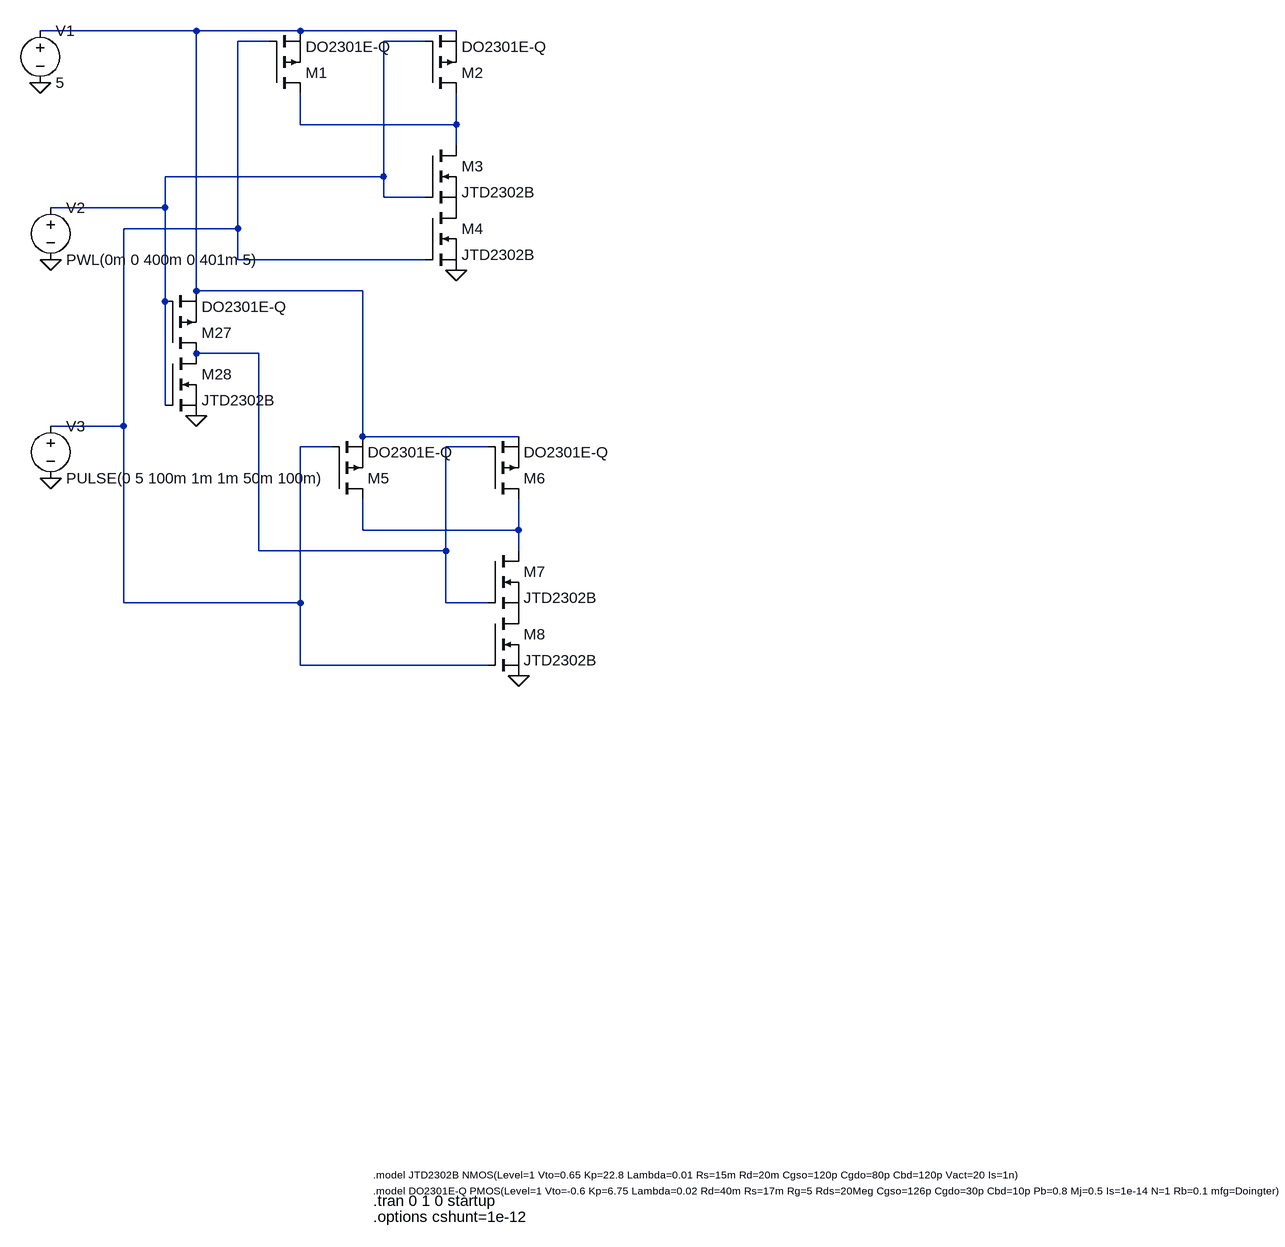
[diagram p0: schematic mainSimulation.asc]
mainSimulation.asc, the LTspice schematic file:
Version 4.1
SHEET 1 3032 680
WIRE -688 -1488 -928 -1488
WIRE -528 -1488 -688 -1488
WIRE -288 -1488 -528 -1488
WIRE -576 -1472 -624 -1472
WIRE -336 -1472 -400 -1472
WIRE -528 -1344 -528 -1392
WIRE -288 -1344 -288 -1392
WIRE -288 -1344 -528 -1344
WIRE -288 -1312 -288 -1344
WIRE -400 -1264 -400 -1472
WIRE -400 -1264 -736 -1264
WIRE -400 -1232 -400 -1264
WIRE -336 -1232 -400 -1232
WIRE -736 -1216 -736 -1264
WIRE -736 -1216 -912 -1216
WIRE -624 -1184 -624 -1472
WIRE -624 -1184 -800 -1184
WIRE -624 -1136 -624 -1184
WIRE -336 -1136 -624 -1136
WIRE -688 -1088 -688 -1488
WIRE -432 -1088 -688 -1088
WIRE -736 -1072 -736 -1216
WIRE -592 -992 -688 -992
WIRE -736 -912 -736 -1072
WIRE -800 -880 -800 -1184
WIRE -800 -880 -912 -880
WIRE -432 -864 -432 -1088
WIRE -192 -864 -432 -864
WIRE -480 -848 -528 -848
WIRE -240 -848 -304 -848
WIRE -432 -720 -432 -768
WIRE -192 -720 -192 -768
WIRE -192 -720 -432 -720
WIRE -592 -688 -592 -992
WIRE -304 -688 -304 -848
WIRE -304 -688 -592 -688
WIRE -192 -688 -192 -720
WIRE -800 -608 -800 -880
WIRE -528 -608 -528 -848
WIRE -528 -608 -800 -608
WIRE -304 -608 -304 -688
WIRE -240 -608 -304 -608
WIRE -528 -512 -528 -608
WIRE -240 -512 -528 -512
FLAG -688 -896 0
FLAG -288 -1120 0
FLAG -192 -496 0
FLAG -928 -1408 0
FLAG -912 -800 0
FLAG -912 -1136 0
SYMBOL pmos -736 -992 M180
SYMATTR InstName M27
SYMATTR Value DO2301E-Q
SYMBOL nmos -736 -992 R0
SYMATTR InstName M28
SYMATTR Value JTD2302B
SYMBOL pmos -576 -1392 M180
SYMATTR InstName M1
SYMATTR Value DO2301E-Q
SYMBOL pmos -336 -1392 M180
SYMATTR InstName M2
SYMATTR Value DO2301E-Q
SYMBOL nmos -336 -1312 R0
SYMATTR InstName M3
SYMATTR Value JTD2302B
SYMBOL nmos -336 -1216 R0
SYMATTR InstName M4
SYMATTR Value JTD2302B
SYMBOL pmos -480 -768 M180
SYMATTR InstName M5
SYMATTR Value DO2301E-Q
SYMBOL pmos -240 -768 M180
SYMATTR InstName M6
SYMATTR Value DO2301E-Q
SYMBOL nmos -240 -688 R0
SYMATTR InstName M7
SYMATTR Value JTD2302B
SYMBOL nmos -240 -592 R0
SYMATTR InstName M8
SYMATTR Value JTD2302B
SYMBOL voltage -928 -1504 R0
WINDOW 123 0 0 Left 0
WINDOW 39 0 0 Left 0
SYMATTR InstName V1
SYMATTR Value 5
SYMBOL voltage -912 -1232 R0
WINDOW 123 0 0 Left 0
WINDOW 39 0 0 Left 0
SYMATTR InstName V2
SYMATTR Value PWL(0m 0 400m 0 401m 5)
SYMBOL voltage -912 -896 R0
WINDOW 123 0 0 Left 0
WINDOW 39 0 0 Left 0
SYMATTR InstName V3
SYMATTR Value PULSE(0 5 100m 1m 1m 50m 100m)
TEXT -416 272 Left 1 !.model JTD2302B NMOS(Level=1 Vto=0.65 Kp=22.8 Lambda=0.01 Rs=15m Rd=20m Cgso=120p Cgdo=80p Cbd=120p Vact=20 Is=1n)
TEXT -416 296 Left 1 !.model DO2301E-Q PMOS(Level=1 Vto=-0.6 Kp=6.75 Lambda=0.02 Rd=40m Rs=17m Rg=5 Rds=20Meg Cgso=126p Cgdo=30p Cbd=10p Pb=0.8 Mj=0.5 Is=1e-14 N=1 Rb=0.1 mfg=Doingter)
TEXT -416 312 Left 2 !.tran 0 1 0 startup
TEXT -416 336 Left 2 !.options cshunt=1e-12

The netlist it stands for:
* mainSimulation.asc
M27 N005 N003 N001 N001 DO2301E-Q
M28 N005 N003 0 0 JTD2302B
M1 N004 N002 N001 N001 DO2301E-Q
M2 N004 N003 N001 N001 DO2301E-Q
M3 N004 N003 P001 P001 JTD2302B
M4 P001 N002 0 0 JTD2302B
M5 N006 N002 N001 N001 DO2301E-Q
M6 N006 N005 N001 N001 DO2301E-Q
M7 N006 N005 P002 P002 JTD2302B
M8 P002 N002 0 0 JTD2302B
V1 N001 0 5
V2 N003 0 PWL(0m 0 400m 0 401m 5)
V3 N002 0 PULSE(0 5 100m 1m 1m 50m 100m)
.model NMOS NMOS
.model PMOS PMOS
.lib standard.mos
.model JTD2302B NMOS(Level=1 Vto=0.65 Kp=22.8 Lambda=0.01 Rs=15m Rd=20m Cgso=120p Cgdo=80p Cbd=120p Vact=20 Is=1n)
.model DO2301E-Q PMOS(Level=1 Vto=-0.6 Kp=6.75 Lambda=0.02 Rd=40m Rs=17m Rg=5 Rds=20Meg Cgso=126p Cgdo=30p Cbd=10p Pb=0.8 Mj=0.5 Is=1e-14 N=1 Rb=0.1 mfg=Doingter)
.tran 0 1 0 startup
.options cshunt=1e-12
.backanno
.end